# Altium schematic sheet brake_circuit.SchDoc
size A4; SheetNumber: 3; SheetTotal: 8
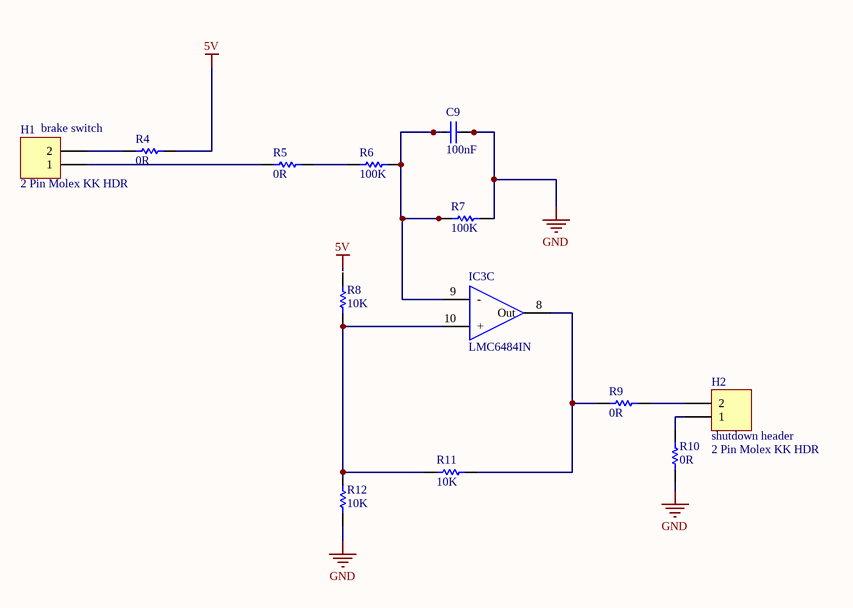
[diagram p0: brake_circuit.SchDoc]

## Parts
C9  100nF  [CAPC1608L]
H1  brake switch  value 2 Pin Molex KK HDR  [MOLEX_KK_2_HDR]
H2  shutdown header  value 2 Pin Molex KK HDR  [MOLEX_KK_2_HDR]
IC3  LMC6484IN  [DIP794W56P254L1905H533Q14N]  (part C of 4)
R4  0R  [RESC1608L]
R5  0R  [RESC1608L]
R6  100K  [RESC1608L]
R7  100K  [RESC1608L]
R8  10K  [RESC1608L]
R9  0R  [RESC1608L]
R10  0R  [RESC1608L]
R11  10K  [RESC1608L]
R12  10K  [RESC1608L]

## Nets
5V: R4.2
GND: C9.2 R7.2 R10.1 R12.1
NetC9_1: C9.1 IC3.9(-) R6.2 R7.1
NetH1_1: H1.1 R5.1
NetH1_2: H1.2 R4.1
NetH2_1: H2.1 R10.2
NetH2_2: H2.2 R9.2
NetIC3_8: IC3.8(Out) R9.1 R11.1
NetIC3_10: IC3.10(+) R8.1 R11.2 R12.2
NetR5_2: R5.2 R6.1

Not connected (* = marked no-connect by the designer): R8 2

## Library data of the parts
C9 = CC_100nF_0603: CAP CER 100nF X7R +-10% 50V 0603; PackageReference: 0603; Code_IPC: 1608 [0603]; Verify: *; Supplier: ECE Dept; Storage Location: PCB Assembly WS; Value: 100nF
H1 = JA_MOLEX_KK_2POS: Supplier 1: Farnell; Supplier Part Number 1: 1462926; Supplier: ECE Dept; Storage Location: ECE Dept Store
H2 = JA_MOLEX_KK_2POS: CONN HEADER 2POS 2.54mm VERT_Thru Hole; Supplier 1: Farnell; Supplier Part Number 1: 1462926; Supplier: ECE Dept; Storage Location: ECE Dept Store
IC3 = LMC6484IN: Integrated Circuit; Manufacturer_Name: Texas Instruments; Datasheet Link: http://www.ti.com/lit/gpn/lmc6484; Height: 5.334mm; Manufacturer_Part_Number: LMC6484IN; Arrow Part Number: LMC6484IN; Mouser Part Number: 926-LMC6484IN; Mouser Price/Stock: https://www.mouser.com/Search/Refine.aspx?Keyword=926-LMC6484IN
R4 R5 R9 R10 = RS_0R0: RES 0.0 OHM 1/10W 5% 0603 SMD; Storage Location: PCB Assembly WS; Supplier: ECE Dept; Value: 0R
R6 R7 = RS_100K: RES 100K OHM 1/10W 5% 0603 SMD; Storage Location: PCB Assembly WS; Supplier: ECE Dept; Value: 100K
R8 R11 R12 = RS_10K: RES 10.0K OHM 1/10W 5% 0603 SMD; Storage Location: PCB Assembly WS; Supplier: ECE Dept; Value: 10K